# Altium schematic sheet Sch_Z35_Wireless_board.SchDoc
size C; SheetNumber: 2; SheetTotal: 3
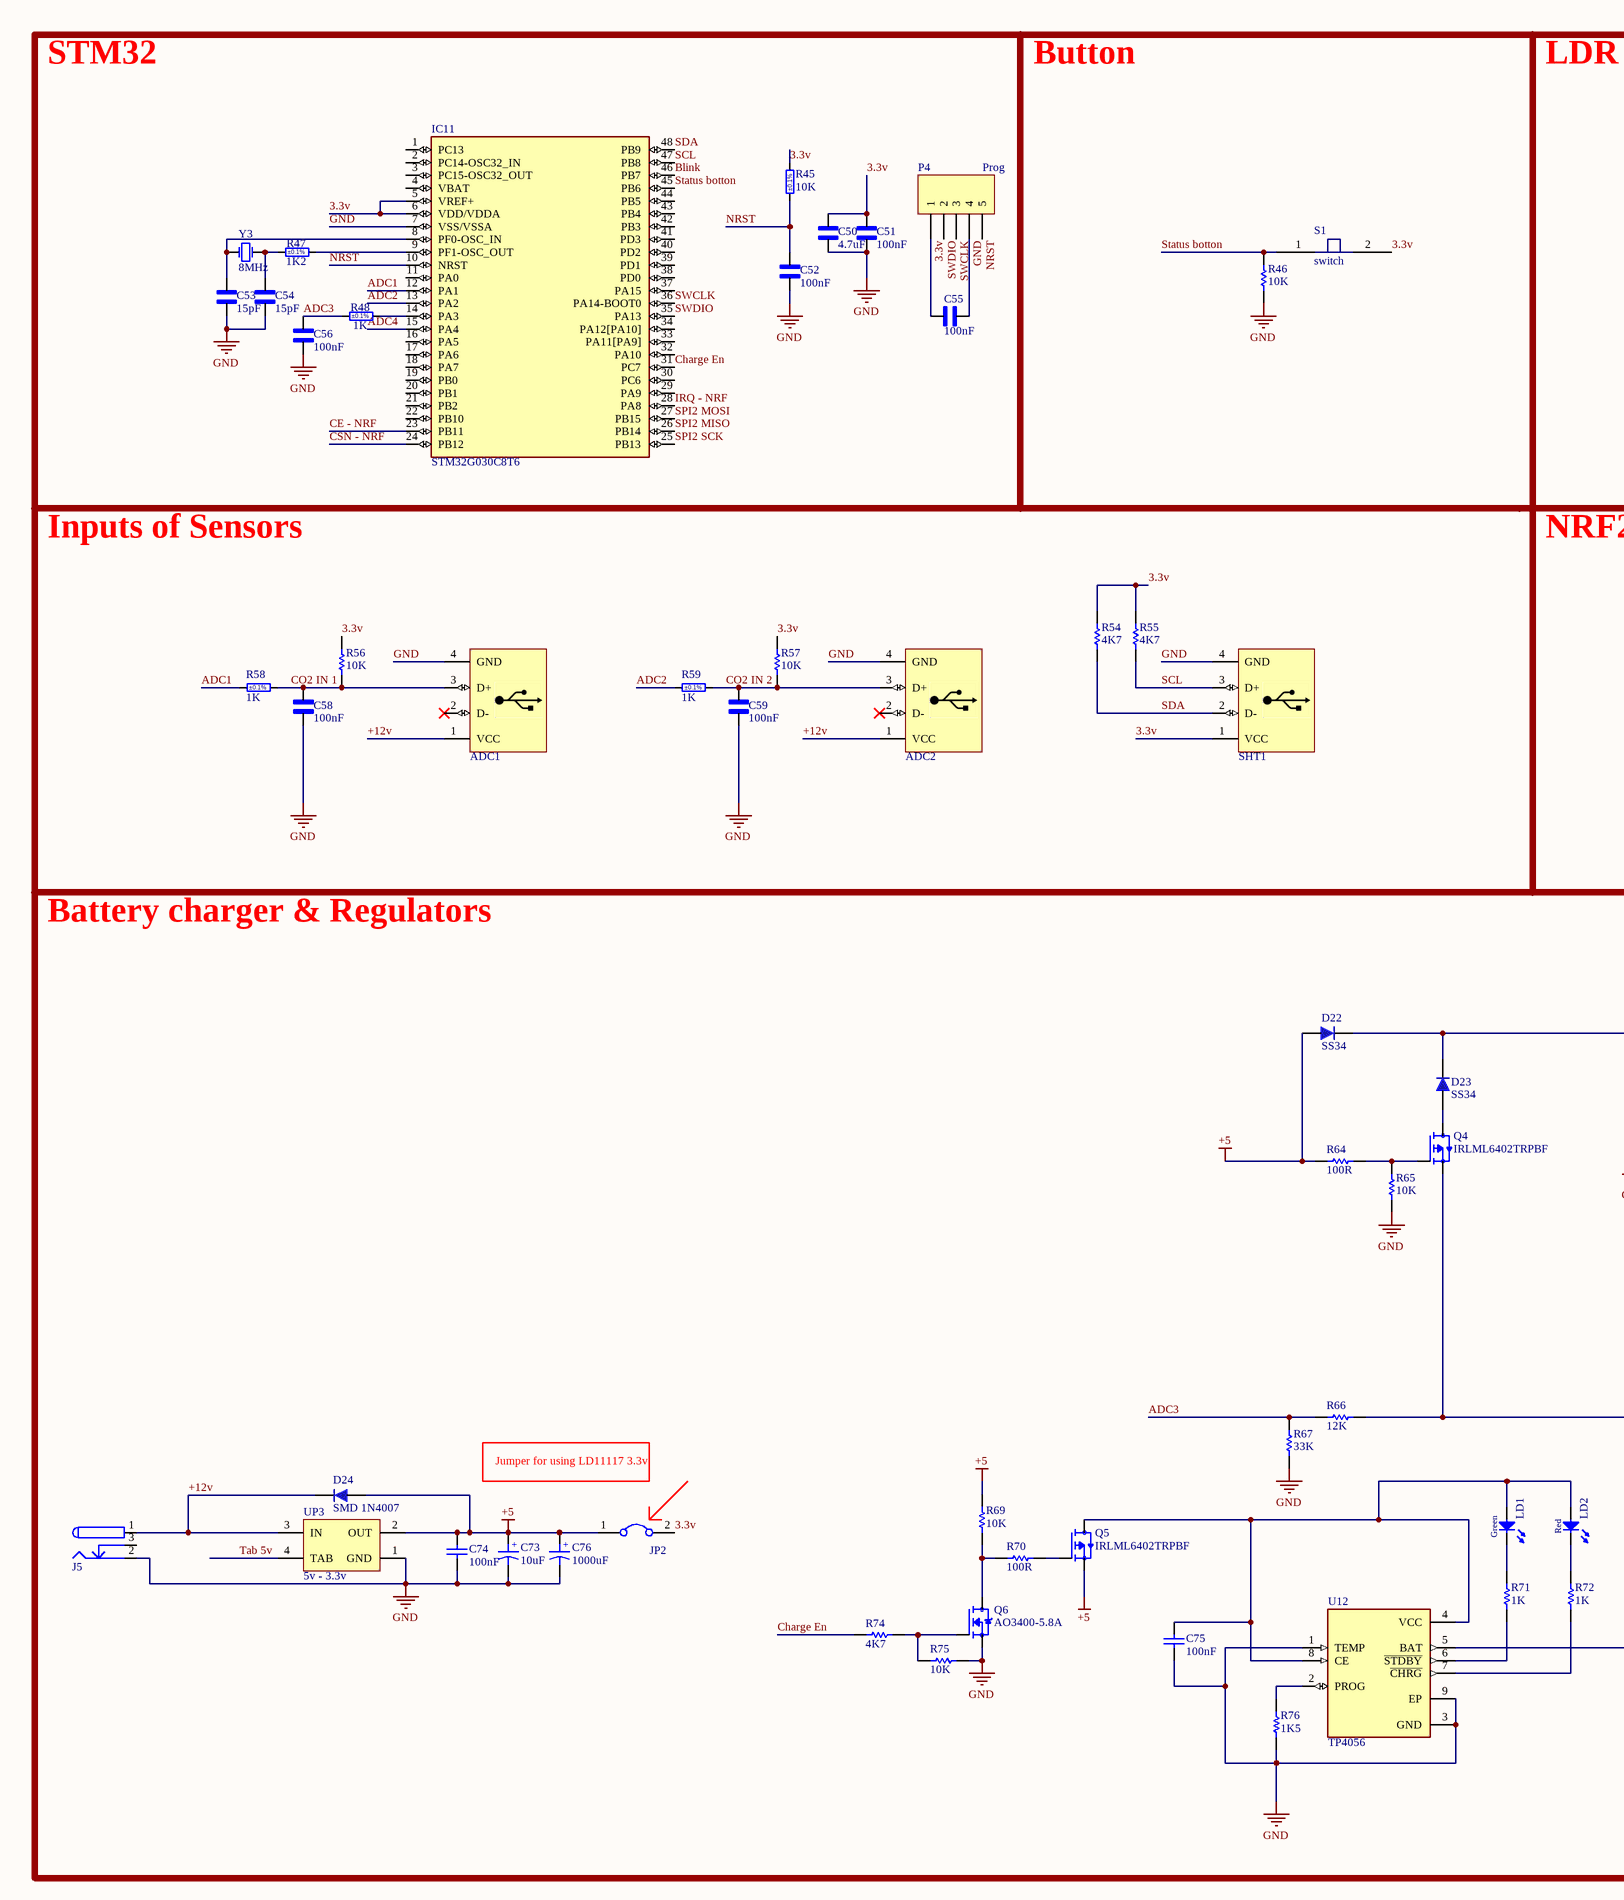
[diagram p0: Sch_Z35_Wireless_board.SchDoc, left]
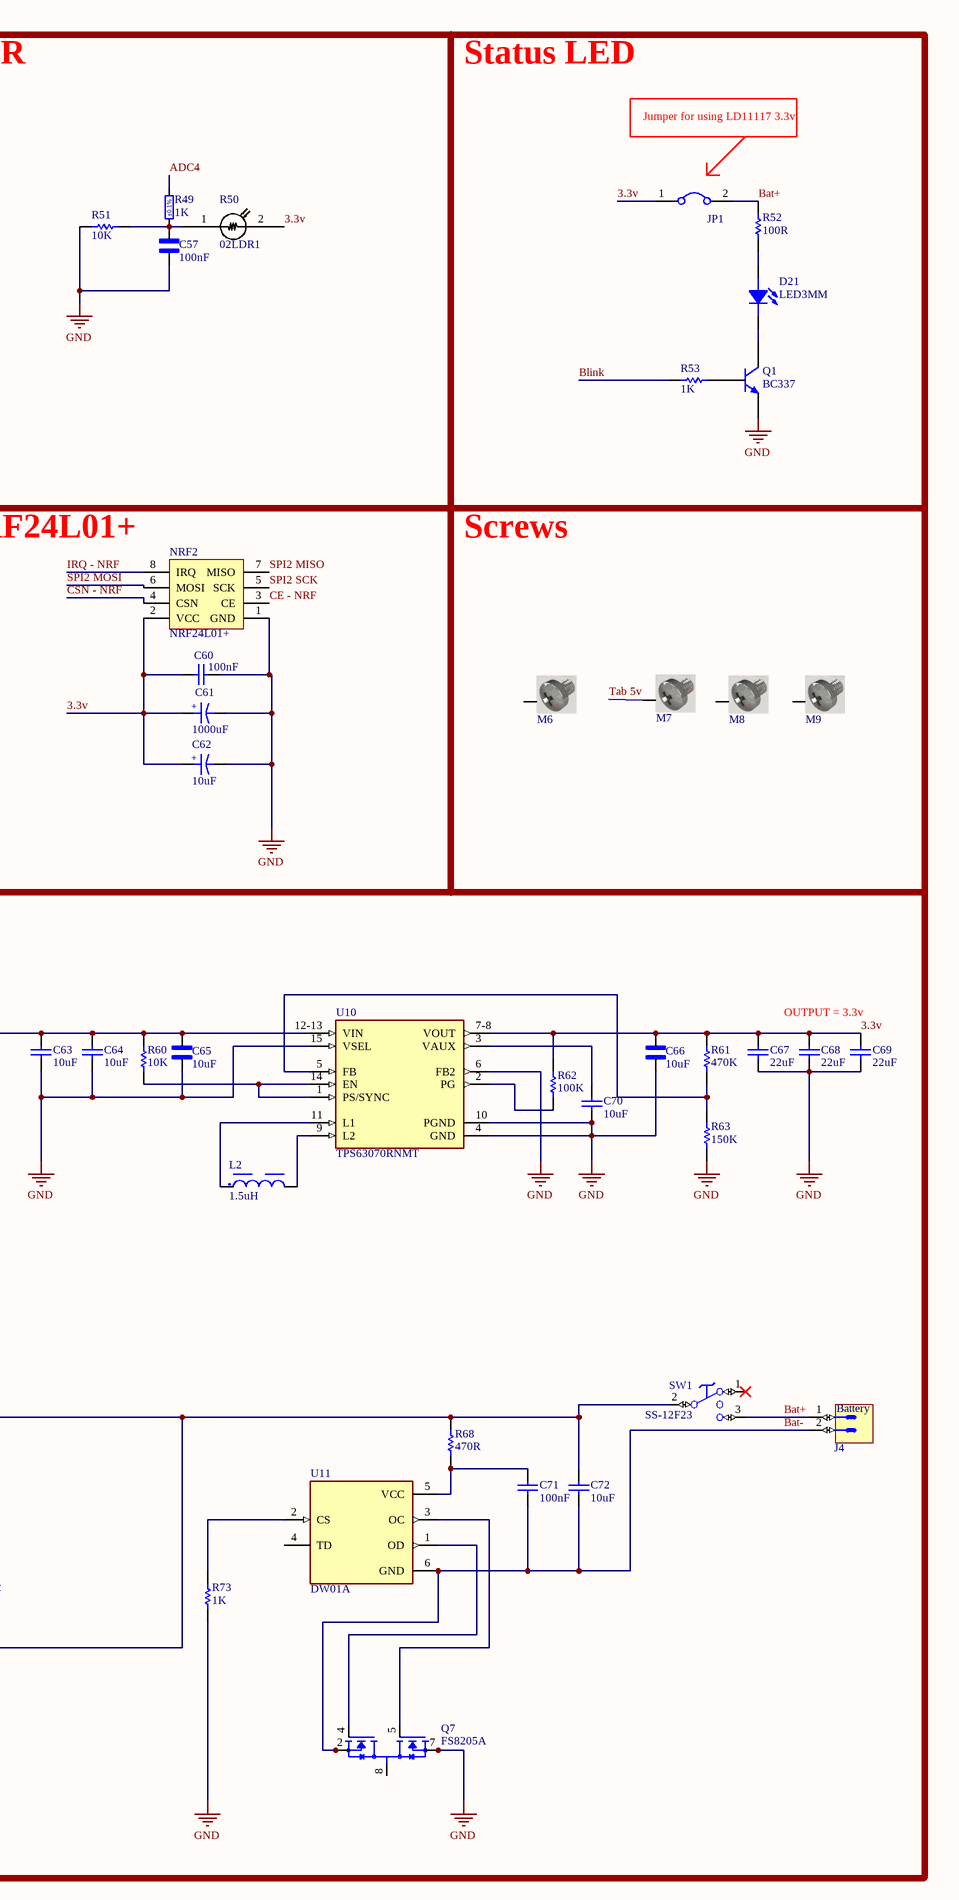
[diagram p1: Sch_Z35_Wireless_board.SchDoc, right]

## Parts
ADC1  USB Connector  [USB2.5-2H4C]  (value not drawn)
ADC2  USB Connector  [USB2.5-2H4C]  (value not drawn)
C50  4.7uF  [CAPC1608X90]
C51  100nF  [CAPC1608X90]
C52  100nF  [CAPC1608X90]
C53  15pF  [CAPC1608X90]
C54  15pF  [CAPC1608X90]
C55  100nF  [CAPC1608X90]
C56  100nF  [CAPC1608X90]
C57  100nF  [CAPC1608X90]
C58  100nF  [CAPC1608X90]
C59  100nF  [CAPC1608X90]
C60  100nF  [CAPC3413X12N]
C61  1000uF  [Cap electrolitic radial 8x14-3.5]
C62  10uF  [Cap electrolitic radial 6.3x12-2.5]
C63  10uF  [CAPC3413X12N]
C64  10uF  [CAPC3413X12N]
C65  10uF  [CAPC1608X90]
C66  10uF  [CAPC1608X90]
C67  22uF  [CAPC3413X12N]
C68  22uF  [CAPC3413X12N]
C69  22uF  [CAPC3413X12N]
C70  10uF  [CAPC3413X12N]
C71  100nF  [CAPC3413X12N]
C72  10uF  [CAPC3413X12N]
C73  10uF  [Cap electrolitic radial 6.3x12-2.5]
C74  100nF  [CAPC3413X12N]
C75  100nF  [CAPC3413X12N]
C76  1000uF  [Cap electrolitic radial 8x14-3.5]
D21  LED3MM  [LED3mm_GRN]
D22  SS34  [DIODE SMD]
D23  SS34  [DIODE SMD]
D24  SMD 1N4007  [DIODE SMD]
IC11  STM32G030C8T6  [QFP50P900X900X160-48N]
J4  Battery  [MOLEX_22-04-1021]
J5  DC Power Jack  [DC Power Jack 1]  (value not drawn)
JP1  Jumper  [Jumper Small - 2.54 - GRAY]  (value not drawn)
JP2  Jumper  [Jumper Small - 2.54 - GRAY]  (value not drawn)
L2  1.5uH  [WE-LHMI_7030]
LD1  Green  [LED_3MM_GREEN_1C-2A]
LD2  Red  [LED_3MM_RED_1C-2A]
M6  Screw3mm  [Board Screw 3mm]  (value not drawn)
M7  Screw3mm  [Board Screw 3mm]  (value not drawn)
M8  Screw3mm  [Board Screw 3mm]  (value not drawn)
M9  Screw3mm  [Board Screw 3mm]  (value not drawn)
NRF2  NRF24L01+  [NRF24L01P]
P4  Prog  [HDR1X5]
Q1  BC337  [SOT23_M]
Q4  IRLML6402TRPBF  [SOT95P237X112-3N]
Q5  IRLML6402TRPBF  [SOT95P237X112-3N]
Q6  AO3400-5.8A  [SOT95P260X140-3N]
Q7  FS8205A  [SOP65P640X120-8N]
R45  10K  Tolerance: ±0.1%  [RESC1608X55N]
R46  10K  [RESC3413X04N]
R47  1K2  Tolerance: ±0.1%  [RESC1608X55N]
R48  1K  Tolerance: ±0.1%  [RESC1608X55N]
R49  1K  Tolerance: ±0.1%  [RESC1608X55N]
R50  02LDR1  [LDR1_NTE]
R51  10K  [RESC3413X04N]
R52  100R  [RESC3413X04N]
R53  1K  [RESC3413X04N]
R54  4K7  [RESC3413X04N]
R55  4K7  [RESC3413X04N]
R56  10K  [RESC3413X04N]
R57  10K  [RESC3413X04N]
R58  1K  Tolerance: ±0.1%  [RESC1608X55N]
R59  1K  Tolerance: ±0.1%  [RESC1608X55N]
R60  10K  [RESC3413X04N]
R61  470K  [RESC3413X04N]
R62  100K  [RESC3413X04N]
R63  150K  [RESC3413X04N]
R64  100R  [RESC3413X04N]
R65  10K  [RESC3413X04N]
R66  12K  [RESC3413X04N]
R67  33K  [RESC3413X04N]
R68  470R  [RESC3413X04N]
R69  10K  [RESC3413X04N]
R70  100R  [RESC3413X04N]
R71  1K  [RESC3413X04N]
R72  1K  [RESC3413X04N]
R73  1K  [RESC3413X04N]
R74  4K7  [RESC3413X04N]
R75  10K  [RESC3413X04N]
R76  1K5  [RESC3413X04N]
S1  switch  [PCBComponent_1]
SHT1  USB Connector  [USB2.5-2H4C]  (value not drawn)
SW1  SS-12F23  [SW_C&K_110xM2S3AxE2]
U10  TPS63070RNMT  [QFN50P250X300X100-15N]
U11  DW01A  [SOT95P280X145-6N]
U12  TP4056  [SOP127P600X175-9N]
UP3  5v - 3.3v  [SOT223]
Y3  8MHz  [CRYSTAL Small]

## Blocks framed on the sheet
STM32: C50-C56 IC11 P4 R45 R47 R48 Y3

## Nets
+5: C73.1 C74.1 C76.1 D22.1 D24.1 JP2.1 Q5.2(S) R64.2 R69.2 UP3.2(OUT)
GND: ADC1.4(GND) ADC2.4(GND) C50.2 C51.2 C52.2 C53.2 C54.2 C55.2 C56.2 C57.2 C58.2 C59.2 C60.1 C61.2 C62.2 C63.2 C64.2 C65.2 C66.2 C67.2 C68.2 C69.2 C70.2 C73.2 C74.2 C75.2 C76.2 IC11.7(VSS/VSSA) J5.2 NRF2.1(GND) P4.4 Q1.2(E) Q6.2(S) Q7.6(S2) Q7.7(S2) R46.1 R51.1 R63.1 R65.2 R67.2 R73.1 R75.2 R76.2 SHT1.4(GND) U10.4(GND) U10.6(FB2) U10.10(PGND) U10.15(VSEL) U12.1(TEMP) U12.3(GND) U12.9(EP) UP3.1(GND)
3.3v: C50.1 C51.1 C55.1 C60.2 C61.1 C62.1 C66.1 C67.1 C68.1 C69.1 IC11.5(VREF+) IC11.6(VDD/VDDA) JP1.1 JP2.2 NRF2.2(VCC) P4.1 R45.2 R50.2 R54.1 R55.1 R56.1 R57.1 R61.2 R62.2 S1.2 SHT1.1(VCC) U10.7-8(VOUT)
+12v: ADC1.1(VCC) ADC2.1(VCC) D24.2 J5.1 UP3.3(IN)
ADC1: IC11.12(PA1) R58.2
ADC2: IC11.13(PA2) R59.2
ADC3: C56.1 R48.1 R66.2 R67.1
ADC4: IC11.15(PA4) R49.2
Bat+: J4.1 JP1.2 R52.2 SW1.3(NO)
Bat-: C71.2 C72.2 J4.2 Q7.2(S1) Q7.3(S1) U11.6(GND)
Blink: IC11.46(PB7) R53.2
CE - NRF: IC11.23(PB11) NRF2.3(CE)
Charge En: IC11.31(PC7) R74.1
CO2 IN 1: ADC1.3(D+) C58.1 R56.2 R58.1
CO2 IN 2: ADC2.3(D+) C59.1 R57.2 R59.1
CSN - NRF: IC11.24(PB12) NRF2.4(CSN)
IRQ - NRF: IC11.28(PA8) NRF2.8(IRQ)
NRST: C52.1 IC11.10(NRST) P4.5 R45.1
SCL: IC11.47(PB8) R55.2 SHT1.3(D+)
SDA: IC11.48(PB9) R54.2 SHT1.2(D-)
SPI2 MISO: IC11.26(PB14) NRF2.7(MISO)
SPI2 MOSI: IC11.27(PB15) NRF2.6(MOSI)
SPI2 SCK: IC11.25(PB13) NRF2.5(SCK)
Status botton: IC11.45(PB6) R46.2 S1.1
SWCLK: IC11.36(PA14-BOOT0) P4.3
SWDIO: IC11.35(PA13) P4.2
Tab 5v: M7.S UP3.4(TAB)
NetC53_1: C53.1 IC11.8(PF0-OSC_IN) Y3.1(OSC1)
NetC54_1: C54.1 R47.1 Y3.2(OSC2)
NetC57_1: C57.1 R49.1 R50.1 R51.2
NetC63_1: C63.1 C64.1 C65.1 D22.2 D23.2 R60.2 U10.12-13(VIN)
NetC70_1: C70.1 U10.3(VAUX)
NetC71_1: C71.1 R68.2 U11.5(VCC)
NetC72_1: C72.1 Q4.2(S) R66.1 R68.1 SW1.2(C) U12.5(BAT)
NetC75_1: C75.1 LD1.2(A) LD2.2(A) Q5.3(D) U12.4(VCC) U12.8(CE)
NetD21_1: D21.1(ANODE) R52.1
NetD21_2: D21.2(CATHODE) Q1.3(C)
NetD23_1: D23.1 Q4.3(D)
NetIC11_9: IC11.9(PF1-OSC_OUT) R47.2
NetIC11_14: IC11.14(PA3) R48.2
NetL2_1: L2.1 U10.11(L1)
NetL2_2: L2.2 U10.9(L2)
NetLD1_1: LD1.1(C) R71.2
NetLD2_1: LD2.1(C) R72.2
NetQ1_1: Q1.1(B) R53.1
NetQ4_1: Q4.1(G) R64.1 R65.1
NetQ5_1: Q5.1(G) R70.2
NetQ6_1: Q6.1(G) R74.2 R75.1
NetQ6_3: Q6.3(D) R69.1 R70.1
NetQ7_1: Q7.1(D12) Q7.8(D12)
NetQ7_4: Q7.4(G1) U11.1(OD)
NetQ7_5: Q7.5(G2) U11.3(OC)
NetR60_1: R60.1 U10.1(PS/SYNC) U10.14(EN)
NetR61_1: R61.1 R63.2 U10.5(FB)
NetR62_1: R62.1 U10.2(PG)
NetR71_1: R71.1 U12.6(~{STDBY})
NetR72_1: R72.1 U12.7(~{CHRG})
NetR73_2: R73.2 U11.2(CS)
NetR76_1: R76.1 U12.2(PROG)

Not connected (* = marked no-connect by the designer): ADC1 2(D-)*; ADC2 2(D-)*; IC11 1(PC13) 2(PC14-OSC32_IN) 3(PC15-OSC32_OUT) 4(VBAT) 11(PA0) 16(PA5) 17(PA6) 18(PA7) 19(PB0) 20(PB1) 21(PB2) 22(PB10) 29(PA9) 30(PC6) 32(PA10) 33(PA11[PA9]) 34(PA12[PA10]) 37(PA15) 38(PD0) 39(PD1) 40(PD2) 41(PD3) 42(PB3) 43(PB4) 44(PB5); J5 3; M6 S; M8 S; M9 S; SW1 1(NC)*; U11 4(TD)

## Notes on the sheet
- Button
- LDR
- Status LED
- Jumper for using LD11117 3.3v
- Inputs of Sensors
- NRF24L01+
- Screws
- Battery charger & Regulators
- OUTPUT = 3.3v
- (in symbol Cap ELECTROLITIC TOTAL SIZE) +

## Library data of the parts
ADC1 ADC2 SHT1 = USB A-Type: USB Connector-A Type
C50-C59 C65 C66 = Cap 0603: 0603 C 100nF Ceramic Multilayer Capacitor, 25 V, +125degC, X7R Dielectric, +/-5% | KEMET C0603C104J3RACTU; SnapEDA_Link: https://www.snapeda.com/parts/C0603C104J3RACTU/KEMET/view-part/?ref=snap; Package: 603-2 KEMET; Value: *; MF: KEMET; MP: C0603C104J3RACTU; Check_prices: https://www.snapeda.com/parts/C0603C104J3RACTU/KEMET/view-part/?ref=eda
C60 C63 C64 C67-C72 C74 C75 = CAP SMD 0805: CAP 0805; Designer: Abbas Basereh; Desc.: CAP SMD 0805; Data: 16-12-2016
C61 C62 C73 C76 = Cap ELECTROLITIC TOTAL SIZE: Cap electrolitic radial; Designer: Abbas Basereh; VALUE: 1uF; Data: 16-12-2016; Part. No: *
D21 = LED 3MM: Light Emitting Diode; Designer: Ali Hafizi
D22-D24 = Diode SMD Package: Diode SMD Pakage
IC11 = STM32G030C8T6: ARMÂ® CortexÂ®-M0+ series Microcontroller IC 32-Bit Single-Core 64MHz 64KB (64K x 8) FLASH 48-LQFP (7x7); MF: STMicroelectronics; Check_prices: https://www.snapeda.com/parts/STM32G030C8T6/STMicroelectronics/view-part/?ref=eda; Purchase-URL: https://pricing.snapeda.com/search/part/STM32G030C8T6/?ref=eda; Price: None; Availability: In Stock; Package: LQFP-48 STMicroelectronics; SnapEDA_Link: https://www.snapeda.com/parts/STM32G030C8T6/STMicroelectronics/view-part/?ref=snap; Value: *; MP: STM32G030C8T6
J4 = MOLEX_22-04-1021: Connector 2 Male; Part Description: 2.5mm (.100") Pitch KK® Wire-to-Board Header, Vertical, with Friction Lock, 2 Circuits, Tin (Sn) Plating; Manufacturer: MOLEX; PressFit: No; Part Number: MOLEX_22-04-1021; Component Kind: Standard; Component Type: Standard; Pin Count: 2; Family: KK®; Mounted: Yes; Socket: No; SMD: No; Sense: No; Status: Obsolete; Manufacturer Part Number: 22-04-1021; ComponentHeight: 11.7mm; HelpURL: \\cern.ch\dfs\Applications\Altium\Datasheets\MOLEX_22-04-1021.pdf; Author: CERN DEM JLC; CreateDate: 2/9/2012; LatestRevisionDate: 2/9/2012
J5 = DC Power Jack: DC Power Jack. Center Pin 2.5mm. Diameter: 5.7mm; Designer: Ali Hafizi; Company: Personal; Project Name: Laser; Adding Date: 10/21/2009
JP1 JP2 = Jumper: Company: E.P.I.L; Defualt State: Close; Design Date: 2011/11/02
L2 = TMPC0603H-1R5MG-D: SMD Power Choke Coil 1.5uH 18A 7.3x6.6mm; MP: altium_native_batch; Package: None; Price: None; Value: *; Availability: Unavailable
LD1 = LED_AVAGO_HLMP-1790: LED Green 1C 2A; Part Description: 3mm Green LED; Manufacturer: AVAGO TECHNOLOGIES; PressFit: No; Bonding: No; Part Number: LED_AVAGO_HLMP-1790; Component Kind: Standard; Component Type: Standard; Color: Green; PackageDescription: LED, Green, Body Dia. 3.43 mm, Pin spacing 2.54mm; Manufacturer Part Number: HLMP-1790; Pin Count: 2; Mounted: Yes; Socket: No; SMD: No; Sense: No; ComponentHeight: 6.35mm(min); HelpURL: \\cern.ch\dfs\Applications\Altium\Datasheets\LED_AVAGO_HLMP-1790.pdf; Author: CERN DEM JLC; CreateDate: 6/12/2008; LatestRevisionDate: 3/17/2010
LD2 = LED_AVAGO_HLMP-1700: LED Red 1C 2A; Part Description: 3mm Red LED; Manufacturer: AVAGO TECHNOLOGIES; PressFit: No; Bonding: No; Part Number: LED_AVAGO_HLMP-1700; Component Kind: Standard; Component Type: Standard; Color: Red; PackageDescription: LED, Red, Body Dia. 3.43 mm, Pin spacing 2.54mm; Manufacturer Part Number: HLMP-1700; Pin Count: 2; Mounted: Yes; Socket: No; SMD: No; Sense: No; ComponentHeight: 6.35mm(min); HelpURL: \\cern.ch\dfs\Applications\Altium\Datasheets\LED_AVAGO_HLMP-1700.pdf; Author: CERN DEM JLC; CreateDate: 6/12/2008; LatestRevisionDate: 3/17/2010
M6-M9 = Board Screw 3mm: Board Screw With Spacer 3mm; Designer: Abbas Basereh; Data: 16-12-2016; Link: *; Part. No: *
NRF2 = NRF24L01P: RF Module; Ali Hafizi: Creature
P4 = Header 5: Header, 5-Pin; LatestRevisionDate: 17-Jul-2002; LatestRevisionNote: Re-released for DXP Platform.; Publisher: Altium Limited
Q1 = BC337: 45 V, 500 mA NPN general-purpose transistors; Published: 2017-2-8; LatestRevisionDate: 2017; LatestRevisionNote: IPC-7351 Footprint Added.; DatasheetVersion: 2017; PackageVersion: 2017-2-8; PackageReference: SOT23; Publisher: Abbas Basereh; PackageDescription: 3-Pin SOT-23 Package 0.95 mm Pitch, 2.3 mm Lead Span; ComponentLink1Description: Manufacturer Link; ComponentLink1URL: http://www.nxp.com/; ComponentLink2Description: Datasheet; ComponentLink2URL: http://www.nxp.com/
Q4 Q5 = IRLML6402TRPBF: P-Channel 20 V 3.7A (Ta) 1.3W (Ta) Surface Mount Micro3Ã¢â€žÂ¢ /SOT-23; MF: Infineon; SnapEDA_Link: https://www.snapeda.com/parts/IRLML6402TRPBF/Infineon/view-part/?ref=snap; Package: SOT-23-3 ON Semiconductor; Value: *; MP: IRLML6402TRPBF; Check_prices: https://www.snapeda.com/parts/IRLML6402TRPBF/Infineon/view-part/?ref=eda
Q6 = AO3400-5.8A: N-Channel 30 V 5.8A (Ta) 1.5W (Ta) Surface Mount SOT-23; MF: MDD; Check_prices: https://www.snapeda.com/parts/AO3400-5.8A/MDD/view-part/?ref=eda; Value: *; Availability: In Stock; MP: AO3400-5.8A; Price: None; Package: None; SnapEDA_Link: https://www.snapeda.com/parts/AO3400-5.8A/MDD/view-part/?ref=snap; Purchase-URL: https://pricing.snapeda.com/search/part/AO3400-5.8A/?ref=eda
Q7 = FS8205A: Dual N-Channel Enhancement Mode Power MOSFET; MF: Fortune Semiconductor; SnapEDA_Link: https://www.snapeda.com/parts/FS8205A/Fortune+Semiconductor/view-part/?ref=snap; Package: Package; Value: *; MP: FS8205A; Check_prices: https://www.snapeda.com/parts/FS8205A/Fortune+Semiconductor/view-part/?ref=eda
R45 R47-R49 R58 R59 = R0603_100K_0.1%_0.063W_10PPM: Resistor - 0.1%; Part Description: Thin Film Chip Resistor; Manufacturer: GENERIC; Manufacturer1 Part Number: RN73C1J100KBTDF; Value: 100k; Power: 0.063W; TC: ±10ppm; PressFit: No; Part Number: R0603_100K_0.1%_0.063W_10PPM; Component Kind: Standard; Component Type: Standard; Pin Count: 2; Status: Not Recommended; Manufacturer Part Number: R0603_100K_0.1%_0.063W_10PPM; Case: 0603; Mounted: Yes; Sense: No; Socket: No; SMD: Yes; Manufacturer1 Example: TYCO HOLSWORTHY; Manufacturer1 ComponentHeight: 0.55mm; HelpURL: \\cern.ch\dfs\Applications\Altium\Datasheets\R0603_Tyco_RN73.pdf; Author: CERN DEM JLC; CreateDate: 12/3/2007; LatestRevisionDate: 3/13/2008
R46 R51-R57 R60-R76 = RES 0805 0.125W: RES 0805; Designer: Abbas Basereh; Desc.: RES SMD 0805; Data: 16-12-2016
R50 = LDR 12mm: 12mm LDR / PIN to PIN is 9mm; Manufacturer_Name: NTE Electronics; Copyright: Copyright (C) 2025 Ultra Librarian. All rights reserved.; Manufacturer_Part_Number: 02LDR1; RefDes: RefDes; Type: Type
S1 = stand_key
SW1 = SW_C&K_1103M2S3AQE2: SPDT Switch; Part Description: Right Angled PC Thru-Hole SPDT Slide Switch, .200" High Actuator, C&K 1000 Series; Manufacturer: C&K; PressFit: No; Sense Comment: Non-washable; Part Number: SW_C&K_1103M2S3AQE2; Component Kind: Standard; Component Type: Standard; Pin Count: 5; PackageDescription: Right Angle, PC Thru-Hole SPDT Slide Switch, .200" High Actuator, C&K 1000 Series; Family: Switch; Mounted: Yes; Socket: No; SMD: No; Sense: Yes; Status: None; Manufacturer Part Number: 1103M2S3AQE2; ComponentHeight: 6.6mm; HelpURL: \\cern.ch\dfs\Applications\Altium\Datasheets\SW_C&K_1103M2S3AQE2.pdf; Author: CERN DEM BC; CreateDate: 7/1/2019; LatestRevisionDate: 7/1/2019
U10 = TPS63070RNMT: TPS63070 2-V to 16-V Buck-Boost Converter With 3.6-A Switch Current; MF: Texas Instruments; SnapEDA_Link: https://www.snapeda.com/parts/TPS63070RNMT/Texas+Instruments/view-part/?ref=snap; Package: VQFN-HR-15 Texas Instruments; Value: *; MP: TPS63070RNMT; Check_prices: https://www.snapeda.com/parts/TPS63070RNMT/Texas+Instruments/view-part/?ref=eda
U11 = DW01A: One Cell Lithium-ion/Polymer Battery Protection IC; MF: Fortune Semiconductor; SnapEDA_Link: https://www.snapeda.com/parts/DW01A/Fortune+Semiconductor/view-part/?ref=snap; Package: SOT-23-6 Fortune Semiconductor; Value: *; MP: DW01A; Check_prices: https://www.snapeda.com/parts/DW01A/Fortune+Semiconductor/view-part/?ref=eda
U12 = TP4056: Complete single cell Li-Ion battery with a constant current / constant voltage linear charger; MF: NanJing Top Power ASIC Corp.; Check_prices: https://www.snapeda.com/parts/TP4056/NanJing+Top+Power+ASIC+Corp./view-part/?ref=eda; SnapEDA_Link: https://www.snapeda.com/parts/TP4056/NanJing+Top+Power+ASIC+Corp./view-part/?ref=snap; Price: None; Availability: Not in stock; Package: Package; MP: TP4056; Value: *
UP3 = AMS1117-x.x: x.x Volt, 800mA Low-Dropout Linear Regulator, 4-pin SOT-223; Designer: Ali Hafizi; Data: 16-12-2016
Y3 = XTAL: XTAL Crystal; Designer: ABBAS BASEREH; Value: 12 MHz; Design Date: 2017-1-3; ComponentLink1Description: Datasheet; ComponentLink2Description: Reference; Mounting Technology: Surface Mount\Through-Hole; Status: Unreleased